# Altium project Interface-Board-7500-0428.PrjPcb (part 1 of 4)
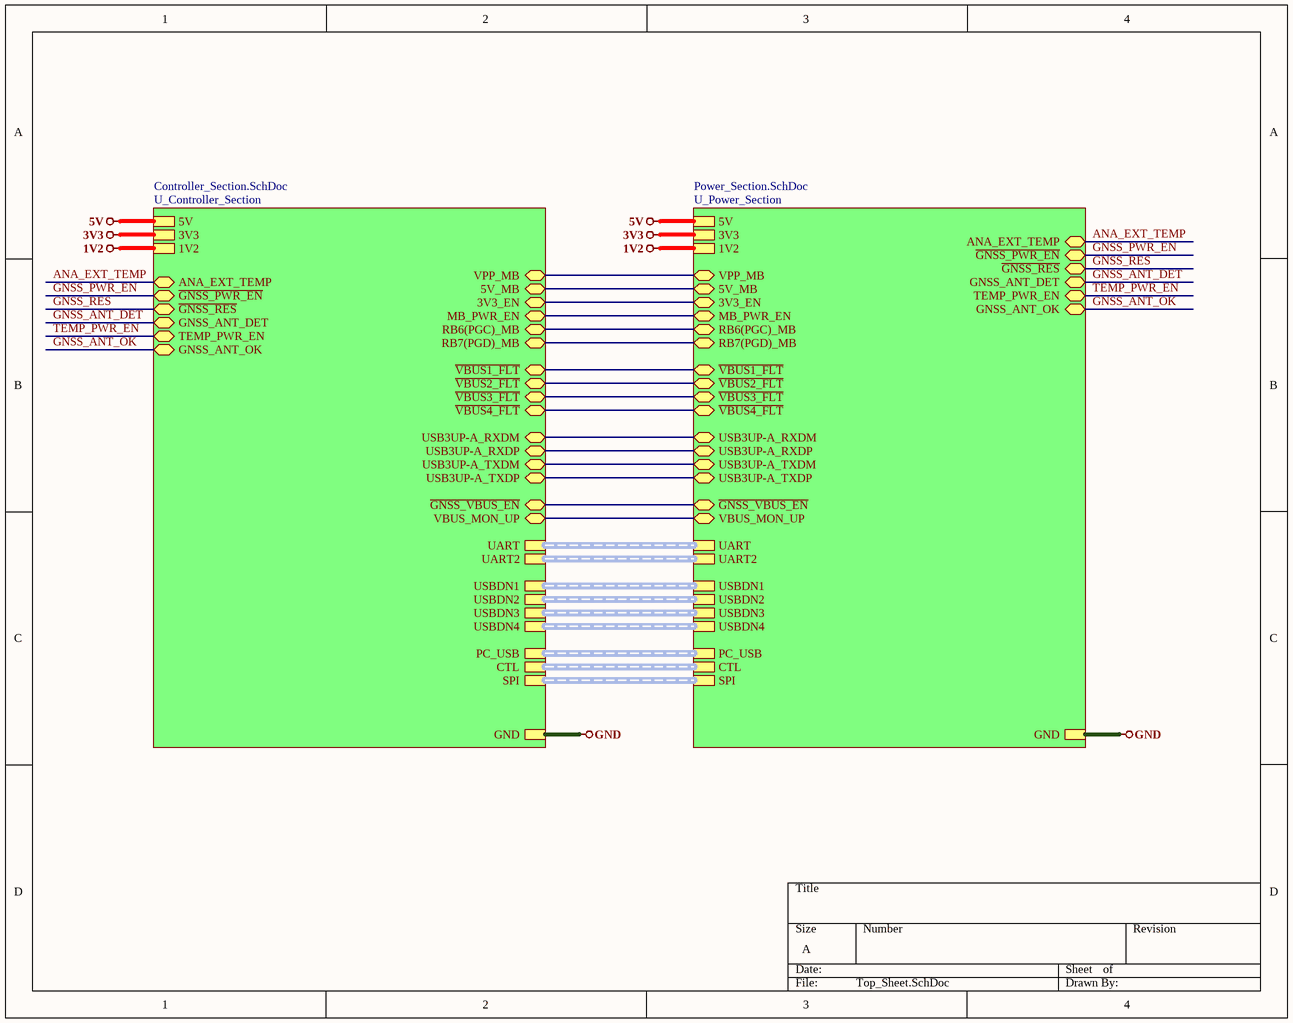
[diagram p0: Top_Sheet.SchDoc]
3 sheets, 247 parts. Net scope: hierarchical (ports join the sheet entries above them; power ports are global).
Board file: PCB_Interface_Board_7500-0428.PcbDoc
Sheets:
  Top_Sheet.SchDoc
    U_Controller_Section = Controller_Section.SchDoc
    U_Power_Section = Power_Section.SchDoc

## Sheet Top_Sheet.SchDoc
size A; SheetNumber: 1; SheetTotal: 3

### Sub-sheets
U_Controller_Section = Controller_Section.SchDoc: RB6(PGC)_MB (bidir), RB7(PGD)_MB (bidir), VPP_MB (bidir), 5V_MB (bidir), 3V3_EN (bidir), MB_PWR_EN (bidir), USB3UP-A_RXDM (bidir), USB3UP-A_RXDP (bidir), USB3UP-A_TXDM (bidir), USB3UP-A_TXDP (bidir), UART (harness UART1), USBDN1 (harness USBDN1), USBDN2 (harness USBDN2), USBDN3 (harness USBDN3), USBDN4 (harness USBDN4), UART2 (harness UART2), PC_USB (harness PC_USB), ~{VBUS1_FLT} (bidir), ~{VBUS2_FLT} (bidir), ~{VBUS3_FLT} (bidir), ~{VBUS4_FLT} (bidir), CTL (harness CTL), ~{GNSS_VBUS_EN} (bidir), SPI (harness SPI), VBUS_MON_UP (bidir), GND, 1V2, 3V3, 5V, ANA_EXT_TEMP (bidir), ~{GNSS_PWR_EN} (bidir), ~{GNSS_RES} (bidir), GNSS_ANT_DET (bidir), TEMP_PWR_EN (bidir), GNSS_ANT_OK (bidir)
U_Power_Section = Power_Section.SchDoc: GND, 1V2, 3V3, 5V, CTL (harness CTL), SPI (harness SPI), 3V3_EN (bidir), MB_PWR_EN (bidir), UART (harness UART1), RB6(PGC)_MB (bidir), RB7(PGD)_MB (bidir), VPP_MB (bidir), 5V_MB (bidir), USBDN1 (harness USBDN1), USBDN2 (harness USBDN2), USBDN3 (harness USBDN3), USBDN4 (harness USBDN4), ~{VBUS1_FLT} (bidir), UART2 (harness UART2), PC_USB (harness PC_USB), USB3UP-A_RXDM (bidir), USB3UP-A_RXDP (bidir), USB3UP-A_TXDM (bidir), USB3UP-A_TXDP (bidir), ~{VBUS2_FLT} (bidir), ~{VBUS3_FLT} (bidir), ~{GNSS_VBUS_EN} (bidir), VBUS_MON_UP (bidir), ~{VBUS4_FLT} (bidir), ANA_EXT_TEMP (bidir), ~{GNSS_PWR_EN} (bidir), ~{GNSS_RES} (bidir), GNSS_ANT_DET (bidir), TEMP_PWR_EN (bidir), GNSS_ANT_OK (bidir)

### Nets
1V2: sheet U_Controller_Section/1V2, sheet U_Power_Section/1V2
3V3: sheet U_Controller_Section/3V3, sheet U_Power_Section/3V3
5V: sheet U_Controller_Section/5V, sheet U_Power_Section/5V
GND: sheet U_Controller_Section/GND, sheet U_Power_Section/GND
3V3_EN: sheet U_Controller_Section/3V3_EN, sheet U_Power_Section/3V3_EN
5V_MB: sheet U_Controller_Section/5V_MB, sheet U_Power_Section/5V_MB
ANA_EXT_TEMP: sheet U_Controller_Section/ANA_EXT_TEMP, sheet U_Power_Section/ANA_EXT_TEMP
~{GNSS_PWR_EN}: sheet U_Controller_Section/~{GNSS_PWR_EN}, sheet U_Power_Section/~{GNSS_PWR_EN}
~{GNSS_RES}: sheet U_Controller_Section/~{GNSS_RES}, sheet U_Power_Section/~{GNSS_RES}
~{GNSS_VBUS_EN}: sheet U_Controller_Section/~{GNSS_VBUS_EN}, sheet U_Power_Section/~{GNSS_VBUS_EN}
GNSS_ANT_DET: sheet U_Controller_Section/GNSS_ANT_DET, sheet U_Power_Section/GNSS_ANT_DET
GNSS_ANT_OK: sheet U_Controller_Section/GNSS_ANT_OK, sheet U_Power_Section/GNSS_ANT_OK
MB_PWR_EN: sheet U_Controller_Section/MB_PWR_EN, sheet U_Power_Section/MB_PWR_EN
RB6(PGC)_MB: sheet U_Controller_Section/RB6(PGC)_MB, sheet U_Power_Section/RB6(PGC)_MB
RB7(PGD)_MB: sheet U_Controller_Section/RB7(PGD)_MB, sheet U_Power_Section/RB7(PGD)_MB
TEMP_PWR_EN: sheet U_Controller_Section/TEMP_PWR_EN, sheet U_Power_Section/TEMP_PWR_EN
USB3UP-A_RXDM: sheet U_Controller_Section/USB3UP-A_RXDM, sheet U_Power_Section/USB3UP-A_RXDM
USB3UP-A_RXDP: sheet U_Controller_Section/USB3UP-A_RXDP, sheet U_Power_Section/USB3UP-A_RXDP
USB3UP-A_TXDM: sheet U_Controller_Section/USB3UP-A_TXDM, sheet U_Power_Section/USB3UP-A_TXDM
USB3UP-A_TXDP: sheet U_Controller_Section/USB3UP-A_TXDP, sheet U_Power_Section/USB3UP-A_TXDP
~{VBUS1_FLT}: sheet U_Controller_Section/~{VBUS1_FLT}, sheet U_Power_Section/~{VBUS1_FLT}
~{VBUS2_FLT}: sheet U_Controller_Section/~{VBUS2_FLT}, sheet U_Power_Section/~{VBUS2_FLT}
~{VBUS3_FLT}: sheet U_Controller_Section/~{VBUS3_FLT}, sheet U_Power_Section/~{VBUS3_FLT}
~{VBUS4_FLT}: sheet U_Controller_Section/~{VBUS4_FLT}, sheet U_Power_Section/~{VBUS4_FLT}
VBUS_MON_UP: sheet U_Controller_Section/VBUS_MON_UP, sheet U_Power_Section/VBUS_MON_UP
VPP_MB: sheet U_Controller_Section/VPP_MB, sheet U_Power_Section/VPP_MB

### Buses and harness runs
harness sheet U_Controller_Section/CTL = sheet U_Power_Section/CTL
harness sheet U_Controller_Section/PC_USB = sheet U_Power_Section/PC_USB
harness sheet U_Controller_Section/SPI = sheet U_Power_Section/SPI
harness sheet U_Controller_Section/UART2 = sheet U_Power_Section/UART2
harness sheet U_Controller_Section/UART = sheet U_Power_Section/UART
harness sheet U_Controller_Section/USBDN1 = sheet U_Power_Section/USBDN1
harness sheet U_Controller_Section/USBDN2 = sheet U_Power_Section/USBDN2
harness sheet U_Controller_Section/USBDN3 = sheet U_Power_Section/USBDN3
harness sheet U_Controller_Section/USBDN4 = sheet U_Power_Section/USBDN4

## Sheet Controller_Section.SchDoc
size 420 x 297 mm; SheetNumber: 3; SheetTotal: 3
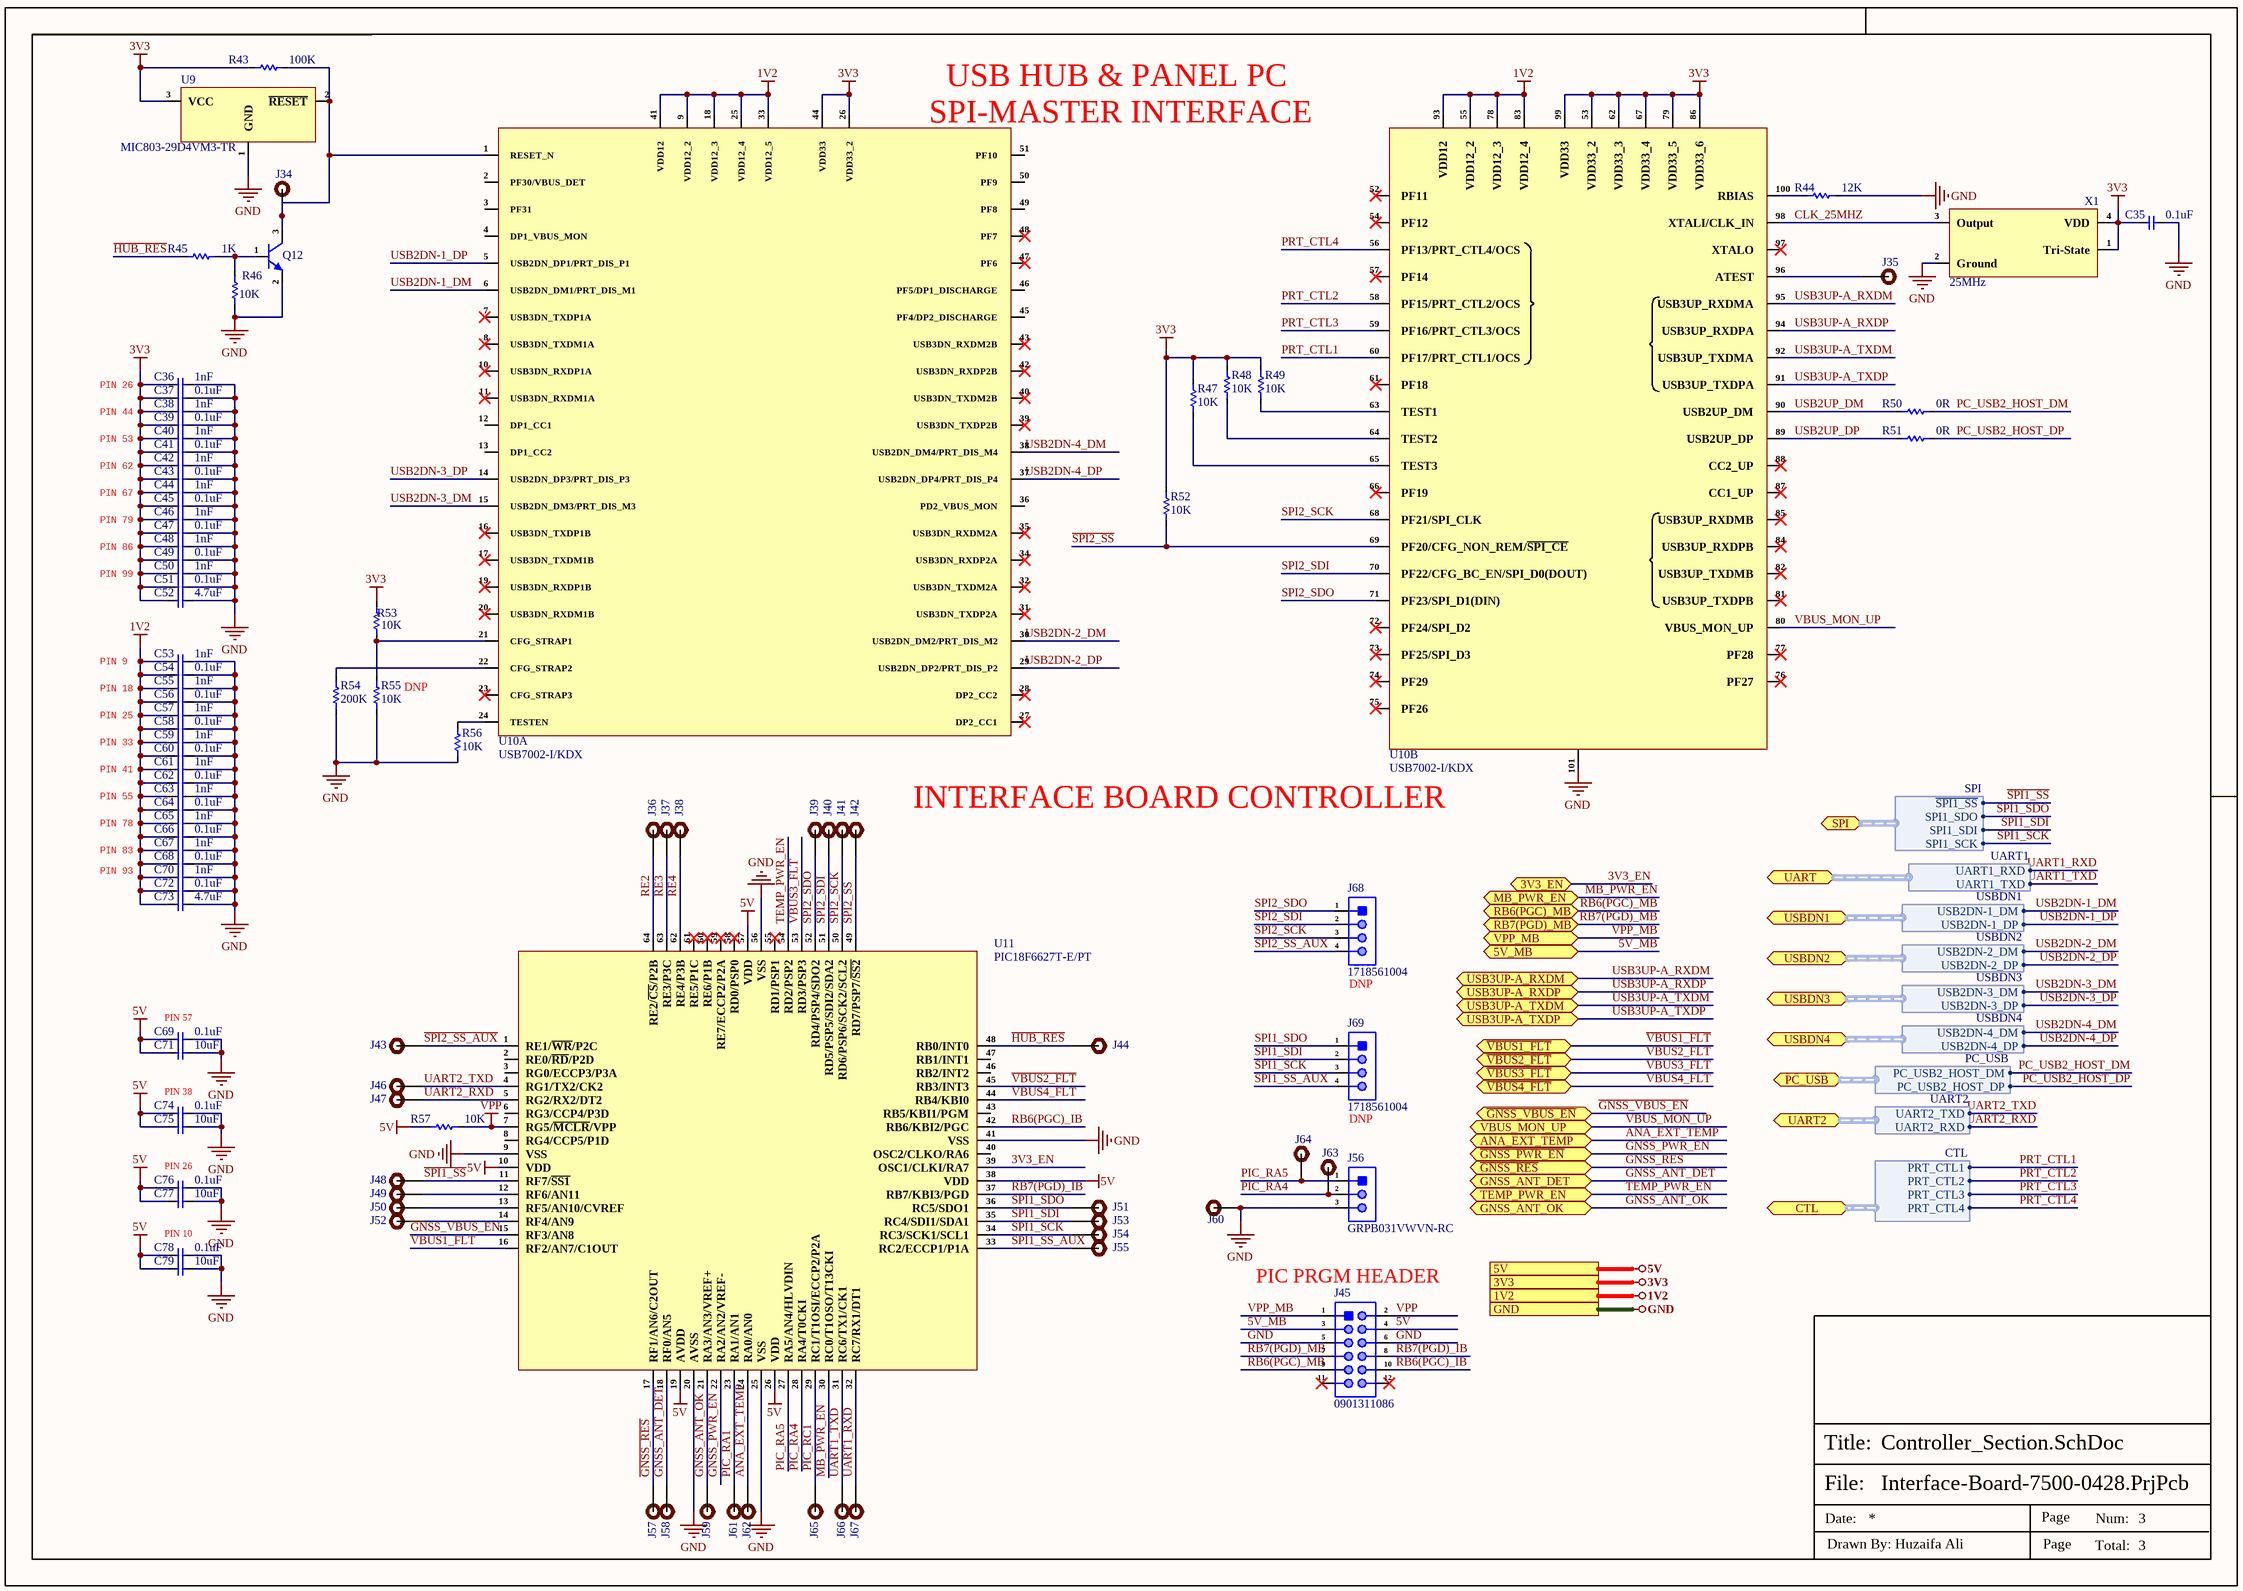
[diagram p1: Controller_Section.SchDoc]

### Parts
C35  0.1uF  [Cap-0402]
C36  1nF  [Cap-0402]
C37  0.1uF  [Cap-0402]
C38  1nF  [Cap-0402]
C39  0.1uF  [Cap-0402]
C40  1nF  [Cap-0402]
C41  0.1uF  [Cap-0402]
C42  1nF  [Cap-0402]
C43  0.1uF  [Cap-0402]
C44  1nF  [Cap-0402]
C45  0.1uF  [Cap-0402]
C46  1nF  [Cap-0402]
C47  0.1uF  [Cap-0402]
C48  1nF  [Cap-0402]
C49  0.1uF  [Cap-0402]
C50  1nF  [Cap-0402]
C51  0.1uF  [Cap-0402]
C52  4.7uF  [Cap-0402]
C53  1nF  [Cap-0402]
C54  0.1uF  [Cap-0402]
C55  1nF  [Cap-0402]
C56  0.1uF  [Cap-0402]
C57  1nF  [Cap-0402]
C58  0.1uF  [Cap-0402]
C59  1nF  [Cap-0402]
C60  0.1uF  [Cap-0402]
C61  1nF  [Cap-0402]
C62  0.1uF  [Cap-0402]
C63  1nF  [Cap-0402]
C64  0.1uF  [Cap-0402]
C65  1nF  [Cap-0402]
C66  0.1uF  [Cap-0402]
C67  1nF  [Cap-0402]
C68  0.1uF  [Cap-0402]
C69  0.1uF  [Cap-0402]
C70  1nF  [Cap-0402]
C71  10uF  [Cap-0402]
C72  0.1uF  [Cap-0402]
C73  4.7uF  [Cap-0402]
C74  0.1uF  [Cap-0402]
C75  10uF  [Cap-0402]
C76  0.1uF  [Cap-0402]
C77  10uF  [Cap-0402]
C78  0.1uF  [Cap-0402]
C79  10uF  [Cap-0402]
J34  Test Point -TH 1.8mm Hole size 0.92mm  [Test Point -TH 1.8mm Hole size 0.92mm]  (value not drawn)  (no BOM)
J35  Test Point -TH 1.8mm Hole size 0.92mm  [Test Point -TH 1.8mm Hole size 0.92mm]  (value not drawn)  (no BOM)
J36  Test Point -TH 1.8mm Hole size 0.92mm  [Test Point -TH 1.8mm Hole size 0.92mm]  (value not drawn)  (no BOM)
J37  Test Point -TH 1.8mm Hole size 0.92mm  [Test Point -TH 1.8mm Hole size 0.92mm]  (value not drawn)  (no BOM)
J38  Test Point -TH 1.8mm Hole size 0.92mm  [Test Point -TH 1.8mm Hole size 0.92mm]  (value not drawn)  (no BOM)
J39  Test Point -TH 1.8mm Hole size 0.92mm  [Test Point -TH 1.8mm Hole size 0.92mm]  (value not drawn)  (no BOM)
J40  Test Point -TH 1.8mm Hole size 0.92mm  [Test Point -TH 1.8mm Hole size 0.92mm]  (value not drawn)  (no BOM)
J41  Test Point -TH 1.8mm Hole size 0.92mm  [Test Point -TH 1.8mm Hole size 0.92mm]  (value not drawn)  (no BOM)
J42  Test Point -TH 1.8mm Hole size 0.92mm  [Test Point -TH 1.8mm Hole size 0.92mm]  (value not drawn)  (no BOM)
J43  Test Point -TH 1.8mm Hole size 0.92mm  [Test Point -TH 1.8mm Hole size 0.92mm]  (value not drawn)  (no BOM)
J44  Test Point -TH 1.8mm Hole size 0.92mm  [Test Point -TH 1.8mm Hole size 0.92mm]  (value not drawn)  (no BOM)
J45  0901311086  [HDR 2x6 Straight (2.54mm)]
J46  Test Point -TH 1.8mm Hole size 0.92mm  [Test Point -TH 1.8mm Hole size 0.92mm]  (value not drawn)  (no BOM)
J47  Test Point -TH 1.8mm Hole size 0.92mm  [Test Point -TH 1.8mm Hole size 0.92mm]  (value not drawn)  (no BOM)
J48  Test Point -TH 1.8mm Hole size 0.92mm  [Test Point -TH 1.8mm Hole size 0.92mm]  (value not drawn)  (no BOM)
J49  Test Point -TH 1.8mm Hole size 0.92mm  [Test Point -TH 1.8mm Hole size 0.92mm]  (value not drawn)  (no BOM)
J50  Test Point -TH 1.8mm Hole size 0.92mm  [Test Point -TH 1.8mm Hole size 0.92mm]  (value not drawn)  (no BOM)
J51  Test Point -TH 1.8mm Hole size 0.92mm  [Test Point -TH 1.8mm Hole size 0.92mm]  (value not drawn)  (no BOM)
J52  Test Point -TH 1.8mm Hole size 0.92mm  [Test Point -TH 1.8mm Hole size 0.92mm]  (value not drawn)  (no BOM)
J53  Test Point -TH 1.8mm Hole size 0.92mm  [Test Point -TH 1.8mm Hole size 0.92mm]  (value not drawn)  (no BOM)
J54  Test Point -TH 1.8mm Hole size 0.92mm  [Test Point -TH 1.8mm Hole size 0.92mm]  (value not drawn)  (no BOM)
J55  Test Point -TH 1.8mm Hole size 0.92mm  [Test Point -TH 1.8mm Hole size 0.92mm]  (value not drawn)  (no BOM)
J56  GRPB031VWVN-RC  [HDR 1x3 Straight (1.27mm)]
J57  Test Point -TH 1.8mm Hole size 0.92mm  [Test Point -TH 1.8mm Hole size 0.92mm]  (value not drawn)  (no BOM)
J58  Test Point -TH 1.8mm Hole size 0.92mm  [Test Point -TH 1.8mm Hole size 0.92mm]  (value not drawn)  (no BOM)
J59  Test Point -TH 1.8mm Hole size 0.92mm  [Test Point -TH 1.8mm Hole size 0.92mm]  (value not drawn)  (no BOM)
J60  Test Point -TH 1.8mm Hole size 0.92mm  [Test Point -TH 1.8mm Hole size 0.92mm]  (value not drawn)  (no BOM)
J61  Test Point -TH 1.8mm Hole size 0.92mm  [Test Point -TH 1.8mm Hole size 0.92mm]  (value not drawn)  (no BOM)
J62  Test Point -TH 1.8mm Hole size 0.92mm  [Test Point -TH 1.8mm Hole size 0.92mm]  (value not drawn)  (no BOM)
J63  Test Point -TH 1.8mm Hole size 0.92mm  [Test Point -TH 1.8mm Hole size 0.92mm]  (value not drawn)  (no BOM)
J64  Test Point -TH 1.8mm Hole size 0.92mm  [Test Point -TH 1.8mm Hole size 0.92mm]  (value not drawn)  (no BOM)
J65  Test Point -TH 1.8mm Hole size 0.92mm  [Test Point -TH 1.8mm Hole size 0.92mm]  (value not drawn)  (no BOM)
J66  Test Point -TH 1.8mm Hole size 0.92mm  [Test Point -TH 1.8mm Hole size 0.92mm]  (value not drawn)  (no BOM)
J67  Test Point -TH 1.8mm Hole size 0.92mm  [Test Point -TH 1.8mm Hole size 0.92mm]  (value not drawn)  (no BOM)
J68  1718561004  [1718561004]
J69  1718561004  [1718561004]
Q12  MMBT2222ATT3G  [MMBT2222ATT3G]  (value not drawn)
R43  100K  [Res-0402]
R44  12K  [Res-0402]
R45  1K  [Res-0402]
R46  10K  [Res-0402]
R47  10K  [Res-0402]
R48  10K  [Res-0402]
R49  10K  [Res-0402]
R50  0R  [Res-0402]
R51  0R  [Res-0402]
R52  10K  [Res-0402]
R53  10K  [Res-0402]
R54  200K  [Res-0402]
R55  10K  [Res-0402]
R56  10K  [Res-0402]
R57  10K  [Res-0402]
U9  MIC803-29D4VM3-TR  [SOT-23]
U10  USB7002-I/KDX  [100-VQFN (12x12)]  (parts A,B of 2)
U11  PIC18F6627T-E/PT  [64-TQFP (10x10)]
X1  25MHz  [SMD2520-4P]

### Ports
1V2 (see Top_Sheet[1A], Power_Section[6D]), 3V3 (see Top_Sheet[1A], Power_Section[6D]), 3V3_EN (bidir, see Top_Sheet[2B], Power_Section[2A]), 5V (see Top_Sheet[1A], Power_Section[6D]), 5V_MB (bidir, see Top_Sheet[2B], Power_Section[6A]), ANA_EXT_TEMP (bidir, see Top_Sheet[1B], Power_Section[1C]), CTL (bidir, harness CTL, see Top_Sheet[2C], Power_Section[4D]), GND (see Top_Sheet[2C], Power_Section[6D]), GNSS_ANT_DET (bidir, see Top_Sheet[1B], Power_Section[1D]), GNSS_ANT_OK (bidir, see Top_Sheet[1B], Power_Section[1D]), MB_PWR_EN (bidir, see Top_Sheet[2B], Power_Section[2A]), PC_USB (bidir, harness PC_USB, see Top_Sheet[2C], Power_Section[2B]), RB6(PGC)_MB (bidir, see Top_Sheet[2B], Power_Section[6A]), RB7(PGD)_MB (bidir, see Top_Sheet[2B], Power_Section[6A]), SPI (bidir, harness SPI, see Top_Sheet[2C], Power_Section[1A]), TEMP_PWR_EN (bidir, see Top_Sheet[1B], Power_Section[2C]), UART2 (bidir, harness UART2, see Top_Sheet[2C], Power_Section[2B]), UART (bidir, harness UART1, see Top_Sheet[2C], Power_Section[4B]), USB3UP-A_RXDM (bidir, see Top_Sheet[2B], Power_Section[2B]), USB3UP-A_RXDP (bidir, see Top_Sheet[2B], Power_Section[2B]), USB3UP-A_TXDM (bidir, see Top_Sheet[2B], Power_Section[2B]), USB3UP-A_TXDP (bidir, see Top_Sheet[2B], Power_Section[2B]), USBDN1 (bidir, harness USBDN1, see Top_Sheet[2C], Power_Section[4B]), USBDN2 (bidir, harness USBDN2, see Top_Sheet[2C], Power_Section[4B]), USBDN3 (bidir, harness USBDN3, see Top_Sheet[2C], Power_Section[4B]), USBDN4 (bidir, harness USBDN4, see Top_Sheet[2C], Power_Section[4B]), VBUS_MON_UP (bidir, see Top_Sheet[2C], Power_Section[2B]), VPP_MB (bidir, see Top_Sheet[2B], Power_Section[6A]), ~{GNSS_PWR_EN} (bidir, see Top_Sheet[1B], Power_Section[1D]), ~{GNSS_RES} (bidir, see Top_Sheet[1B], Power_Section[1D]), ~{GNSS_VBUS_EN} (bidir, see Top_Sheet[2B], Power_Section[4D]), ~{VBUS1_FLT} (bidir, see Top_Sheet[2B], Power_Section[3C]), ~{VBUS2_FLT} (bidir, see Top_Sheet[2B], Power_Section[3C]), ~{VBUS3_FLT} (bidir, see Top_Sheet[2B], Power_Section[5C]), ~{VBUS4_FLT} (bidir, see Top_Sheet[2B], Power_Section[5C])

### Harnesses
UART1: UART1_RXD, UART1_TXD
USBDN1: USB2DN-1_DM, USB2DN-1_DP
USBDN2: USB2DN-2_DM, USB2DN-2_DP
USBDN3: USB2DN-3_DM, USB2DN-3_DP
USBDN4: USB2DN-4_DM, USB2DN-4_DP
UART2: UART2_TXD, UART2_RXD
PC_USB: PC_USB2_HOST_DM, PC_USB2_HOST_DP
CTL: PRT_CTL1, PRT_CTL2, PRT_CTL3, PRT_CTL4
SPI: SPI1_SDO, SPI1_SCK, SPI1_SDI, ~{SPI1_SS}

### Nets
1V2: C53.1 C54.1 C55.1 C56.1 C57.1 C58.1 C59.1 C60.1 C61.1 C62.1 C63.1 C64.1 C65.1 C66.1 C67.1 C68.1 C70.1 C72.1 C73.1 U10.9(VDD12_2) U10.18(VDD12_3) U10.25(VDD12_4) U10.33(VDD12_5) U10.41(VDD12) U10.55(VDD12_2) U10.78(VDD12_3) U10.83(VDD12_4) U10.93(VDD12) ; port 1V2
3V3: C35.1 C36.1 C37.1 C38.1 C39.1 C40.1 C41.1 C42.1 C43.1 C44.1 C45.1 C46.1 C47.1 C48.1 C49.1 C50.1 C51.1 C52.1 R43.2 R47.2 R48.2 R49.2 R52.2 R53.2 U9.3(VCC) U10.26(VDD33_2) U10.44(VDD33) U10.53(VDD33_2) U10.62(VDD33_3) U10.67(VDD33_4) U10.79(VDD33_5) U10.86(VDD33_6) U10.99(VDD33) X1.1(Tri-State) X1.4(VDD) ; port 3V3
5V: C69.1 C71.1 C74.1 C75.1 C76.1 C77.1 C78.1 C79.1 J45.4 R57.1 U11.10(VDD) U11.19(AVDD) U11.26(VDD) U11.38(VDD) U11.57(VDD) ; port 5V
GND: C35.2 C36.2 C37.2 C38.2 C39.2 C40.2 C41.2 C42.2 C43.2 C44.2 C45.2 C46.2 C47.2 C48.2 C49.2 C50.2 C51.2 C52.2 C53.2 C54.2 C55.2 C56.2 C57.2 C58.2 C59.2 C60.2 C61.2 C62.2 C63.2 C64.2 C65.2 C66.2 C67.2 C68.2 C69.2 C70.2 C71.2 C72.2 C73.2 C74.2 C75.2 C76.2 C77.2 C78.2 C79.2 J45.5 J45.6 J56.3 J60.1 Q12.2(E) R44.2 R46.1 R54.1 R55.1 R56.1 U9.1(GND) U10.101(VSS) U11.9(VSS) U11.20(AVSS) U11.25(VSS) U11.41(VSS) U11.56(VSS) X1.2(Ground) ; port GND
VPP: J45.2 R57.2 U11.7(RG5/~{MCLR}/VPP)
3V3_EN: U11.39(OSC1/CLKI/RA7) ; port 3V3_EN
5V_MB: J45.3 ; port 5V_MB
ANA_EXT_TEMP: J62.1 U11.24(RA0/AN0) ; port ANA_EXT_TEMP
CLK_25MHZ: U10.98(XTALI/CLK_IN) X1.3(Output)
~{GNSS_PWR_EN}: U11.22(RA2/AN2/VREF-) ; port ~{GNSS_PWR_EN}
~{GNSS_RES}: J57.1 U11.17(RF1/AN6/C2OUT) ; port ~{GNSS_RES}
~{GNSS_VBUS_EN}: U11.15(RF3/AN8) ; port ~{GNSS_VBUS_EN}
GNSS_ANT_DET: J58.1 U11.18(RF0/AN5) ; port GNSS_ANT_DET
GNSS_ANT_OK: J59.1 U11.21(RA3/AN3/VREF+) ; port GNSS_ANT_OK
~{HUB_RES}: J44.1 R45.1 U11.48(RB0/INT0)
MB_PWR_EN: U11.30(RC0/T1OSO/T13CKI) ; port MB_PWR_EN
PC_USB2_HOST_DM: R50.2 ; port PC_USB.PC_USB2_HOST_DM
PC_USB2_HOST_DP: R51.2 ; port PC_USB.PC_USB2_HOST_DP
PIC_RA1: J61.1 U11.23(RA1/AN1)
PIC_RA4: J56.2 J63.1 U11.28(RA4/T0CKI)
PIC_RA5: J56.1 J64.1 U11.27(RA5/AN4/HLVDIN)
PIC_RC1: J65.1 U11.29(RC1/T1OSI/ECCP2/P2A)
PRT_CTL1: U10.60(PF17/PRT_CTL1/OCS) ; port CTL.PRT_CTL1
PRT_CTL2: U10.58(PF15/PRT_CTL2/OCS) ; port CTL.PRT_CTL2
PRT_CTL3: U10.59(PF16/PRT_CTL3/OCS) ; port CTL.PRT_CTL3
PRT_CTL4: U10.56(PF13/PRT_CTL4/OCS) ; port CTL.PRT_CTL4
RB6(PGC)_IB: J45.10 U11.42(RB6/KBI2/PGC)
RB6(PGC)_MB: J45.9 ; port RB6(PGC)_MB
RB7(PGD)_IB: J45.8 U11.37(RB7/KBI3/PGD)
RB7(PGD)_MB: J45.7 ; port RB7(PGD)_MB
RE2: J36.1 U11.64(RE2/~{CS}/P2B)
RE3: J37.1 U11.63(RE3/P3C)
RE4: J38.1 U11.62(RE4/P3B)
~{SPI1_SS}: J48.1 U11.11(RF7/~{SS1}) ; port SPI.~{SPI1_SS}
~{SPI1_SS_AUX}: J55.1 J69.4 U11.33(RC2/ECCP1/P1A)
~{SPI2_SS}: J42.1 R52.1 U10.69(PF20/CFG_NON_REM/~{SPI_CE}) U11.49(RD7/PSP7/~{SS2})
~{SPI2_SS_AUX}: J43.1 J68.4 U11.1(RE1/~{WR}/P2C)
SPI1_SCK: J54.1 J69.3 U11.34(RC3/SCK1/SCL1) ; port SPI.SPI1_SCK
SPI1_SDI: J53.1 J69.2 U11.35(RC4/SDI1/SDA1) ; port SPI.SPI1_SDI
SPI1_SDO: J51.1 J69.1 U11.36(RC5/SDO1) ; port SPI.SPI1_SDO
SPI2_SCK: J41.1 J68.3 U10.68(PF21/SPI_CLK) U11.50(RD6/PSP6/SCK2/SCL2)
SPI2_SDI: J40.1 J68.2 U10.70(PF22/CFG_BC_EN/SPI_D0(DOUT)) U11.51(RD5/PSP5/SDI2/SDA2)
SPI2_SDO: J39.1 J68.1 U10.71(PF23/SPI_D1(DIN)) U11.52(RD4/PSP4/SDO2)
TEMP_PWR_EN: U11.54(RD2/PSP2) ; port TEMP_PWR_EN
UART1_RXD: J67.1 U11.32(RC7/RX1/DT1) ; port UART.UART1_RXD
UART1_TXD: J66.1 U11.31(RC6/TX1/CK1) ; port UART.UART1_TXD
UART2_RXD: J47.1 U11.5(RG2/RX2/DT2) ; port UART2.UART2_RXD
UART2_TXD: J46.1 U11.4(RG1/TX2/CK2) ; port UART2.UART2_TXD
USB2DN-1_DM: U10.6(USB2DN_DM1/PRT_DIS_M1) ; port USBDN1.USB2DN-1_DM
USB2DN-1_DP: U10.5(USB2DN_DP1/PRT_DIS_P1) ; port USBDN1.USB2DN-1_DP
USB2DN-2_DM: U10.30(USB2DN_DM2/PRT_DIS_M2) ; port USBDN2.USB2DN-2_DM
USB2DN-2_DP: U10.29(USB2DN_DP2/PRT_DIS_P2) ; port USBDN2.USB2DN-2_DP
USB2DN-3_DM: U10.15(USB2DN_DM3/PRT_DIS_M3) ; port USBDN3.USB2DN-3_DM
USB2DN-3_DP: U10.14(USB2DN_DP3/PRT_DIS_P3) ; port USBDN3.USB2DN-3_DP
USB2DN-4_DM: U10.38(USB2DN_DM4/PRT_DIS_M4) ; port USBDN4.USB2DN-4_DM
USB2DN-4_DP: U10.37(USB2DN_DP4/PRT_DIS_P4) ; port USBDN4.USB2DN-4_DP
USB2UP_DM: R50.1 U10.90(USB2UP_DM)
USB2UP_DP: R51.1 U10.89(USB2UP_DP)
USB3UP-A_RXDM: U10.95(USB3UP_RXDMA) ; port USB3UP-A_RXDM
USB3UP-A_RXDP: U10.94(USB3UP_RXDPA) ; port USB3UP-A_RXDP
USB3UP-A_TXDM: U10.92(USB3UP_TXDMA) ; port USB3UP-A_TXDM
USB3UP-A_TXDP: U10.91(USB3UP_TXDPA) ; port USB3UP-A_TXDP
~{VBUS1_FLT}: U11.16(RF2/AN7/C1OUT) ; port ~{VBUS1_FLT}
~{VBUS2_FLT}: U11.45(RB3/INT3) ; port ~{VBUS2_FLT}
~{VBUS3_FLT}: U11.53(RD3/PSP3) ; port ~{VBUS3_FLT}
~{VBUS4_FLT}: U11.44(RB4/KBI0) ; port ~{VBUS4_FLT}
VBUS_MON_UP: U10.80(VBUS_MON_UP) ; port VBUS_MON_UP
VPP_MB: J45.1 ; port VPP_MB
NetJ34_1: J34.1 Q12.3(C) R43.1 U9.2(~{RESET}) U10.1(RESET_N)
NetJ35_1: J35.1 U10.96(ATEST)
NetJ49_1: J49.1 U11.12(RF6/AN11)
NetJ50_1: J50.1 U11.13(RF5/AN10/CVREF)
NetJ52_1: J52.1 U11.14(RF4/AN9)
NetQ12_1: Q12.1(B) R45.2 R46.2
NetR44_1: R44.1 U10.100(RBIAS)
NetR47_1: R47.1 U10.65(TEST3)
NetR48_1: R48.1 U10.64(TEST2)
NetR49_1: R49.1 U10.63(TEST1)
NetR53_1: R53.1 R55.2 U10.21(CFG_STRAP1)
NetR54_2: R54.2 U10.22(CFG_STRAP2)
NetR56_2: R56.2 U10.24(TESTEN)

Not connected (* = marked no-connect by the designer): J45 11* 12*; U10 2(PF30/VBUS_DET) 3(PF31) 4(DP1_VBUS_MON) 7(USB3DN_TXDP1A)* 8(USB3DN_TXDM1A)* 10(USB3DN_RXDP1A)* 11(USB3DN_RXDM1A)* 12(DP1_CC1) 13(DP1_CC2) 16(USB3DN_TXDP1B)* 17(USB3DN_TXDM1B)* 19(USB3DN_RXDP1B)* 20(USB3DN_RXDM1B)* 23(CFG_STRAP3)* 27(DP2_CC1)* 28(DP2_CC2)* 31(USB3DN_TXDP2A)* 32(USB3DN_TXDM2A)* 34(USB3DN_RXDP2A)* 35(USB3DN_RXDM2A)* 36(PD2_VBUS_MON) 39(USB3DN_TXDP2B)* 40(USB3DN_TXDM2B)* 42(USB3DN_RXDP2B)* 43(USB3DN_RXDM2B)* 45(PF4/DP2_DISCHARGE) 46(PF5/DP1_DISCHARGE) 47(PF6)* 48(PF7)* 49(PF8) 50(PF9) 51(PF10) 52(PF11)* 54(PF12)* 57(PF14)* 61(PF18)* 66(PF19)* 72(PF24/SPI_D2)* 73(PF25/SPI_D3)* 74(PF29)* 75(PF26)* 76(PF27)* 77(PF28)* 81(USB3UP_TXDPB)* 82(USB3UP_TXDMB)* 84(USB3UP_RXDPB)* 85(USB3UP_RXDMB)* 87(CC1_UP)* 88(CC2_UP)* 97(XTALO)*; U11 2(RE0/~{RD}/P2D) 3(RG0/ECCP3/P3A) 6(RG3/CCP4/P3D) 8(RG4/CCP5/P1D) 40(OSC2/CLKO/RA6) 43(RB5/KBI1/PGM) 46(RB2/INT2) 47(RB1/INT1) 55(RD1/PSP1)* 58(RD0/PSP0)* 59(RE7/ECCP2/P2A)* 60(RE6/P1B)* 61(RE5/P1C)*

### Notes on the sheet
- (near U10) USB HUB & PANEL PC
  SPI-MASTER INTERFACE
- PIN 26
- PIN 44
- PIN 53
- PIN 62
- PIN 67
- PIN 79
- PIN 99
- PIN 86
- PIN 9
- PIN 18
- PIN 25
- (near R55) DNP
- PIN 41
- PIN 33
- PIN 55
- PIN 78
- PIN 83
- (near U10) INTERFACE BOARD CONTROLLER
- PIN 93
- (near J68) DNP
- (near C69) PIN 57
- (near C74) PIN 38
- (near J69) DNP
- (near C76) PIN 26
- (near C78) PIN 10
- (near J45) PIC PRGM HEADER
- File:
- Title:
- Date:
- Page
- Num:
- Total:
- Drawn By: Huzaifa Ali

### Library data of the parts
C35 C37 C39 C41 C43 C45 C47 C49 C51 C54 C56 C58 C60 C62 C64 C66 C68 C69 C72 C74 C76 C78 = GRM155R71C104KA88D: CAP CER 0.1UF 16V X7R 0402; Manufacturer: Murata; Material: Ceramic; Value: 100nF; Tolerance: 10%; Insulation Resistance: 10GR; Item Type: Capacitor; Supplier 1: Arrow Electronics; Manufacturer Part Number: GRM155R71C104KA88D; RoHS: Yes; Category: Ceramic Capacitors; Stock 1: 1690322; Pricing 1: 10000=0.00480, 30000=0.00470, 100000=0.00350, 250000=0.00330 (USD); Mounting Technology: Surface Mount; Case/Package: 0402; Pins: 2; Case Code (Metric): 1005; Case Code (Imperial): 0402; Dielectric Material: Ceramic; Min Operating Temperature: -55°C; Max Operating Temperature: 125°C; Voltage Rating: 16V; Packaging: Tape and Reel; Voltage Rating (DC): 16V; Package Quantity: 1; Dielectric: X7R; Termination: SMD/SMT; Voltage: 16V; Series: GRM; Length: 1mm; Width: 0.02inch; Height: 0.5mm; Thickness: 0.022inch; Depth: 0.5mm; Radiation Hardening: No; Lead Free: Lead Free; RoHS Compliant: Yes; ComponentLink1URL: https://datasheet.ciiva.com/129/grm155r71c104ka88-01-129739.pdf?src-supplier=Digi-Key; ComponentLink1Description: https://datasheet.ciiva.com/129/grm155r71c104ka88-01-129739.pdf?src-supplier=Digi-Key; ComponentLink2URL: https://datasheet.ciiva.com/129/grm155r71c104ka88-01-129740.pdf?src-supplier=Digi-Key; ComponentLink2Description: https://datasheet.ciiva.com/129/grm155r71c104ka88-01-129740.pdf?src-supplier=Digi-Key; ComponentLink3URL: https://datasheet.ciiva.com/18102/getdatasheetpartid-85307-18102905.pdf?src-supplier=Verical; ComponentLink3Description: https://datasheet.ciiva.com/18102/getdatasheetpartid-85307-18102905.pdf?src-supplier=Verical; ComponentLink4URL: https://datasheet.ciiva.com/29199/454098-da-01-en-vs-kondensator-0402-29199799.pdf?src-supplier=Conrad; ComponentLink4Description: https://datasheet.ciiva.com/29199/454098-da-01-en-vs-kondensator-0402-29199799.pdf?src-supplier=Conrad; ComponentLink5URL: https://datasheet.ciiva.com/7937/4360-7937615.pdf?src-supplier=Element14; ComponentLink5Description: https://datasheet.ciiva.com/7937/4360-7937615.pdf?src-supplier=Element14; ComponentLink6URL: https://datasheet.ciiva.com/14116/grmseries-highdielectrictype-eng-14116878.pdf?src-supplier=Distrelec; ComponentLink6Description: https://datasheet.ciiva.com/14116/grmseries-highdielectrictype-eng-14116878.pdf?src-supplier=Distrelec; ComponentLink7URL: https://datasheet.ciiva.com/14103/grmseries-highdielectrictype-eng-14103750.pdf?src-supplier=Distrelec; ComponentLink7Description: https://datasheet.ciiva.com/14103/grmseries-highdielectrictype-eng-14103750.pdf?src-supplier=Distrelec; ComponentLink8URL: https://datasheet.ciiva.com/28534/4360-28534127.pdf?src-supplier=Element14; ComponentLink8Description: https://datasheet.ciiva.com/28534/4360-28534127.pdf?src-supplier=Element14; ComponentLink9URL: https://datasheet.ciiva.com/28534/4360-28534133.pdf?src-supplier=Element14; ComponentLink9Description: https://datasheet.ciiva.com/28534/4360-28534133.pdf?src-supplier=Element14; ComponentLink10URL: https://datasheet.ciiva.com/16199/product-16199000.pdf?src-supplier=Future+Electronics; ComponentLink10Description: https://datasheet.ciiva.com/16199/product-16199000.pdf?src-supplier=Future+Electronics; Supplier Part Number 1: GRM155R71C104KA88D; LCSC Part Number: C71629
C36 C38 C40 C42 C44 C46 C48 C50 C53 C55 C57 C59 C61 C63 C65 C67 C70 = GRM155R61C102KA01D: Multilayer Ceramic Capacitor, 1000 pF, 16 V, ± 10%, X5R, 0402 [1005 Metric]; Manufacturer: Murata; Voltage Rating: 16V; Supplier: Digikey; Supplier Part Number: 490-6308-6-ND; Manufacturer Part Number: GRM155R61C102KA01D; RoHS: Yes; Category: Ceramic Capacitors; Stock: 36126; Pricing: 1=0.1, 10=0.025, 50=0.0142, 100=0.011, 500=0.0083, 1000=0.00651, 2500=0.00592, 5000=0.00545 (USD); Mounting Technology: Surface Mount; Case/Package: 0402; Case Code (Metric): 1005; Case Code (Imperial): 0402; Min Operating Temperature: -55°C; Max Operating Temperature: 85°C; Value: 1nF; Tolerance: 10%; Dielectric: X5R; Package Quantity: 1; Packaging: Tape and Reel; Voltage Rating (DC): 16V; Termination: SMD/SMT; Series: GRM; Construction: Flat; Length: 1mm; Width: 0.02inch; Height: 0.5mm; Thickness: 0.022inch; Depth: 0.5mm; Radiation Hardening: No; Lead Free: Lead Free; RoHS Compliant: Yes; ComponentLink1URL: https://datasheet.ciiva.com/6263/product-6263633.pdf?src-supplier=Digikey; ComponentLink1Description: https://datasheet.ciiva.com/6263/product-6263633.pdf?src-supplier=Digikey; ComponentLink2URL: https://datasheet.ciiva.com/6263/partnumbering-e-01-6263626.pdf?src-supplier=Digikey; ComponentLink2Description: https://datasheet.ciiva.com/6263/partnumbering-e-01-6263626.pdf?src-supplier=Digikey; ComponentLink3URL: https://datasheet.ciiva.com/6263/partnumbering-e-01-6263629.pdf?src-supplier=Digikey; ComponentLink3Description: https://datasheet.ciiva.com/6263/partnumbering-e-01-6263629.pdf?src-supplier=Digikey
C52 C73 = CC0402KRX5R6BB475: CAP CER 4.7UF 10V X5R 0402; Manufacturer: Yageo; Tolerance: 10%; Supplier 1: Farnell; Manufacturer Part Number: CC0402KRX5R6BB475; RoHS: Yes; Category: Ceramic Capacitors; Stock 1: 20000; Pricing 1: 10000=0.02310, 50000=0.02100 (GBP); Mount: Surface Mount; Case/Package: 0402; Case Code (Imperial): 0402; Case Code (Metric): 1005; Min Operating Temperature: -55°C; Max Operating Temperature: 85°C; Packaging: Cut Tape; Capacitance: 4.7uF; Voltage Rating: 10V; RoHS Compliant: Yes; ComponentLink1URL: http://www.yageo.com/documents/recent/UPY-GPHC_X5R_4V-to-50V_25.pdf?src-supplier=Digi-Key; ComponentLink1Description: http://www.yageo.com/documents/recent/UPY-GPHC_X5R_4V-to-50V_25.pdf?src-supplier=Digi-Key; Supplier Part Number 1: 3871698; LCSC Part Number: C326586
C71 C75 C77 C79 = CC0402MRX5R6BB106: CAP CER 10UF 10V X5R 0402; Manufacturer: Yageo; Tolerance: 20%; Item Type: Capacitor; Supplier 1: Future Electronics; Manufacturer Part Number: CC0402MRX5R6BB106; RoHS: Yes; Category: Ceramic Capacitors; Stock 1: 80000; Pricing 1: 10000=0.02650, 20000=0.02590, 30000=0.02550, 40000=0.02530, 50000=0.02450 (USD); Mount: Surface Mount; Case/Package: 0402; Case Code (Imperial): 0402; Case Code (Metric): 1005; Min Operating Temperature: -55°C; Max Operating Temperature: 85°C; Packaging: Tape and Reel; Capacitance: 10uF; Voltage Rating: 10V; RoHS Compliant: Yes; ComponentLink1URL: http://www.yageo.com/documents/recent/UPY-GPHC_X5R_4V-to-50V_25.pdf?src-supplier=Digi-Key; ComponentLink1Description: http://www.yageo.com/documents/recent/UPY-GPHC_X5R_4V-to-50V_25.pdf?src-supplier=Digi-Key; Supplier Part Number 1: 6097631; LCSC Part Number: C962143
J45 = 0901311086: 2.54mm Pitch C-Grid III Header, Dual Row, Vertical, 12 Circuits, 0.10µm Gold (Au) Selective Plating; Manufacturer: Molex; Number of Positions: 12; Pitch: 0.1inch; Item Type: Header; Supplier: Digikey; Supplier Part Number: WM20588-ND; Manufacturer Part Number: 0901311086; RoHS: Yes; Category: Uncategorized; Stock: 1766; Pricing: 1=1.44, 10=1.224, 80=1.01075, 1200=0.79795, 6000=0.70752, 10800=0.69156 (USD); Mounting Technology: Through Hole; Color: Black; Contact Plating: Gold; Contact Material: Brass; Contact Shape: Square; Contact Finish - Mating: GOLD; Insulation Material: Glass; Insulation Color: Black; Packaging: Bulk; Number of Rows: 2; Termination: Solder; Fastening Type: Pull; Series: C-Grid III™ 90131; Contact Type: Male Pin; Row Spacing: 0.1inch; Contact Mating Length: 0.266inch; RoHS Compliant: Yes; Flammability Rating: UL94 V-0; ComponentLink1URL: https://www.molex.com/pdm_docs/ps/PS-99020-0001-001.pdf?src-supplier=Digikey; ComponentLink1Description: https://www.molex.com/pdm_docs/ps/PS-99020-0001-001.pdf?src-supplier=Digikey; ComponentLink2URL: http://www.molex.com/pdm_docs/sd/901311086_sd.pdf?src-supplier=Digikey; ComponentLink2Description: http://www.molex.com/pdm_docs/sd/901311086_sd.pdf?src-supplier=Digikey
J56 = GRPB031VWVN-RC: CONN HEADER VERT 3POS 1.27MM; Manufacturer: Sullins; Item Type: Connectors; Number of Positions: 3; Supplier: Digikey; Supplier Part Number: S9014E-03-ND; Manufacturer Part Number: GRPB031VWVN-RC; RoHS: Yes; Stock: 29991; Pricing: 1=0.28, 10=0.238, 100=0.185, 500=0.15862, 1000=0.13218, 5000=0.1133, 10000=0.1079 (USD); Mounting Technology: Through Hole; Contact Material: Brass; Contact Shape: Square; Contact Finish - Mating: GOLD; Insulation Material: Nylon; Min Operating Temperature: -40°C; Max Operating Temperature: 105°C; Number of Rows: 1; Packaging: Bulk; Termination: Solder; Connector Type: Header; Contact Type: Male Pin; Fastening Type: Pull; Series: -; Pitch: 1.27mm; Lead Free: Lead Free; RoHS Compliant: Yes; Flammability Rating: UL94 V-0; ComponentLink1URL: https://datasheet.ciiva.com/726/71-grpb-1vwvn-rc-10957-c-726649.pdf?src-supplier=Digikey; ComponentLink1Description: https://datasheet.ciiva.com/726/71-grpb-1vwvn-rc-10957-c-726649.pdf?src-supplier=Digikey
J68 J69 = 1718561004: CONN HEADER VERT 4POS 2.54MM; Manufacturer: Molex; Supplier: Digikey; Supplier Part Number: WM10288-ND; Manufacturer Part Number: 1718561004; RoHS: Yes; Item Type: Header; Pricing: 1=0.73, 10=0.617, 100=0.4796, 4000=0.34254, 8000=0.30829, 12000=0.30372 (USD); ComponentLink1URL: https://datasheet.ciiva.com/24135/1718561004-pcb-headers-295430-24135941.pdf?src-supplier=Mouser; ComponentLink1Description: https://datasheet.ciiva.com/24135/1718561004-pcb-headers-295430-24135941.pdf?src-supplier=Mouser; ComponentLink2URL: https://datasheet.ciiva.com/29151/1718560002-sd-29151999.pdf?src-supplier=Digikey; ComponentLink2Description: https://datasheet.ciiva.com/29151/1718560002-sd-29151999.pdf?src-supplier=Digikey
Q12 = MMBT2222ATT3G: Small Signal Bipolar Transistor, 0.6A I(C), 40V V(BR)CEO, 1-Element, NPN, Silicon; Manufacturer: ON Semiconductor; Supplier: Digikey; Supplier Part Number: MMBT2222ATT3GOSCT-ND; Manufacturer Part Number: MMBT2222ATT3G; RoHS: Yes; Category: BJTs; Stock: 7029; Pricing: 1=0.12, 10=0.082, 100=0.0441, 500=0.03466, 1000=0.02407, 2000=0.01994, 5000=0.01885 (USD); ComponentLink1URL: https://datasheet.ciiva.com/980/mmbt2222lt1-d-980718.pdf?src-supplier=Digikey; ComponentLink1Description: https://datasheet.ciiva.com/980/mmbt2222lt1-d-980718.pdf?src-supplier=Digikey; ComponentLink2URL: https://datasheet.ciiva.com/4724/mmbt2222att1-d-81771-4724629.pdf?src-supplier=Mouser; ComponentLink2Description: https://datasheet.ciiva.com/4724/mmbt2222att1-d-81771-4724629.pdf?src-supplier=Mouser
R43 = RT0402BRD07100KL: RES SMD 100K OHM 0.1% 1/16W 0402; Manufacturer: Yageo; Voltage Rating (DC): 50V; Item Type: Resistor; Supplier: Digikey; Supplier Part Number: YAG1343CT-ND; Manufacturer Part Number: RT0402BRD07100KL; RoHS: Yes; Category: Chip SMD Resistors; Stock: 62932; Pricing: 1=0.16, 10=0.121, 50=0.0958, 100=0.0859, 500=0.0654, 1000=0.0578, 5000=0.04283 (USD); ComponentLink1URL: https://datasheet.ciiva.com/12724/pyu-rt-1-to-0-05-rohs-l-4-12724954.pdf?src-supplier=Mouser; ComponentLink1Description: https://datasheet.ciiva.com/12724/pyu-rt-1-to-0-05-rohs-l-4-12724954.pdf?src-supplier=Mouser; LCSC Part Number: C852472
R44 = RC0402FR-0712KL: RES 12K OHM 1% 1/16W 0402; Manufacturer: Yageo; Value: 12kR; Power Rating: 62.5mW; Voltage Rating: 50V; Max Power Dissipation: 63mW; Temperature Coefficient: 100ppm/°C; Supplier: Future Electronics; Supplier Part Number: 5655139; Manufacturer Part Number: RC0402FR-0712KL; RoHS: Yes; Category: Chip SMD Resistors; Stock: 2030000; Pricing: 10000=0.0011, 100000=0.0011, 300000=0.001, 750000=0.001, 2000000=0.0009 (USD); Case/Package: 0402; Case Code (Metric): 1005; Case Code (Imperial): 0402; Weight: 2.3E-05oz; Min Operating Temperature: -55°C; Max Operating Temperature: 155°C; Packaging: Tape and Reel; Tolerance: 1%; Package Quantity: 1; Resistor Type: Thick Film; Number of Terminations: 2; Termination: SMD/SMT; Features: Moisture Resistant; Series: RC; Resistance Tolerance: 1%; Construction: Rectangular; Voltage Rating (AC): 50V; Length: 1mm; Width: 0.02inch; Height: 0.016inch; Depth: 0.5mm; Reach SVHC Compliant: No; Military Standard: Not; RoHS Compliant: Yes; Lead Free: 5697LeadFree; ComponentLink1URL: https://datasheet.ciiva.com/46412/1018594-46412831.pdf?src-supplier=Element14; ComponentLink1Description: https://datasheet.ciiva.com/46412/1018594-46412831.pdf?src-supplier=Element14; ComponentLink2URL: https://datasheet.ciiva.com/2453/pyu-r-int-thick-7-2453380.pdf?src-supplier=Digikey; ComponentLink2Description: https://datasheet.ciiva.com/2453/pyu-r-int-thick-7-2453380.pdf?src-supplier=Digikey; ComponentLink3URL: https://datasheet.ciiva.com/2453/pyu-r-int-thick-7-2453381.pdf?src-supplier=Digikey; ComponentLink3Description: https://datasheet.ciiva.com/2453/pyu-r-int-thick-7-2453381.pdf?src-supplier=Digikey; ComponentLink4URL: https://datasheet.ciiva.com/2453/pyu-r-int-thick-7-2453379.pdf?src-supplier=Digikey; ComponentLink4Description: https://datasheet.ciiva.com/2453/pyu-r-int-thick-7-2453379.pdf?src-supplier=Digikey; ComponentLink5URL: https://datasheet.ciiva.com/12577/pyu-rc0402-51-rohs-l-6-r-12577269.pdf?src-supplier=Mouser; ComponentLink5Description: https://datasheet.ciiva.com/12577/pyu-rc0402-51-rohs-l-6-r-12577269.pdf?src-supplier=Mouser; ComponentLink6URL: https://datasheet.ciiva.com/7849/1018594-7849833.pdf?src-supplier=Element14; ComponentLink6Description: https://datasheet.ciiva.com/7849/1018594-7849833.pdf?src-supplier=Element14; ComponentLink7URL: https://datasheet.ciiva.com/7849/1018594-7849832.pdf?src-supplier=Element14; ComponentLink7Description: https://datasheet.ciiva.com/7849/1018594-7849832.pdf?src-supplier=Element14; ComponentLink8URL: https://datasheet.ciiva.com/16744/pyu-rc0402-51-rohs-l-6-r-16744492.pdf?src-supplier=Future+Electronics; ComponentLink8Description: https://datasheet.ciiva.com/16744/pyu-rc0402-51-rohs-l-6-r-16744492.pdf?src-supplier=Future+Electronics
R45 = RC0402FR-071KL: RES 1K OHM 1% 1/16W 0402; Manufacturer: Yageo; Resistance: 1kR; Temperature Coefficient: 100ppm/°C; Voltage Rating (DC): 50V; Power Rating: 62.5mW; Max Power Dissipation: 63mW; Item Type: Resistor; Supplier 1: Avnet; Manufacturer Part Number: RC0402FR-071KL; RoHS: Yes; Category: Chip SMD Resistors; Stock 1: 13030000; Pricing 1: 10000=0.00085, 20000=0.00087, 40000=0.00084, 60000=0.00083, 80000=0.00079, 100000=0.00078, 1000000=0.00076 (USD); Case/Package: 0402; Number of Pins: 2; Case Code (Imperial): 0402; Case Code (Metric): 1005; Size Code: 0402; Min Operating Temperature: -55°C; Max Operating Temperature: 155°C; Resistor Type: Thick Film; Tolerance: 1%; Packaging: Tape and Reel; Voltage Rating: 50V; Termination: SMD/SMT; Features: Moisture Resistant; Series: RC; Number of Terminations: 2; Resistance Tolerance: 1%; Construction: Rectangular; Technology: THICK FILM; Length: 1mm; Width: 0.5mm; Height: 0.32mm; Depth: 0.5mm; Reach SVHC Compliant: Yes; Lead Free: Lead Free; RoHS Compliant: Yes; Military Standard: Not; ComponentLink1URL: https://datasheet.ciiva.com/11819/0900766b80c66297-11819477.pdf?src-supplier=RSComponents; ComponentLink1Description: https://datasheet.ciiva.com/11819/0900766b80c66297-11819477.pdf?src-supplier=RSComponents; ComponentLink2URL: https://datasheet.ciiva.com/7983/1018594-7983502.pdf?src-supplier=Element14; ComponentLink2Description: https://datasheet.ciiva.com/7983/1018594-7983502.pdf?src-supplier=Element14; ComponentLink3URL: https://datasheet.ciiva.com/22747/1018594-22747513.pdf?src-supplier=Element14; ComponentLink3Description: https://datasheet.ciiva.com/22747/1018594-22747513.pdf?src-supplier=Element14; ComponentLink4URL: https://datasheet.ciiva.com/12666/pyu-rc0402-51-rohs-l-6-r-12666741.pdf?src-supplier=Mouser; ComponentLink4Description: https://datasheet.ciiva.com/12666/pyu-rc0402-51-rohs-l-6-r-12666741.pdf?src-supplier=Mouser; ComponentLink5URL: https://datasheet.ciiva.com/7849/1018594-7849869.pdf?src-supplier=Element14; ComponentLink5Description: https://datasheet.ciiva.com/7849/1018594-7849869.pdf?src-supplier=Element14; ComponentLink6URL: https://datasheet.ciiva.com/7849/1018594-7849871.pdf?src-supplier=Element14; ComponentLink6Description: https://datasheet.ciiva.com/7849/1018594-7849871.pdf?src-supplier=Element14; ComponentLink7URL: https://datasheet.ciiva.com/17063/pyu-rc0402-51-rohs-l-6-r-17063193.pdf?src-supplier=Future+Electronics; ComponentLink7Description: https://datasheet.ciiva.com/17063/pyu-rc0402-51-rohs-l-6-r-17063193.pdf?src-supplier=Future+Electronics; Supplier Part Number 1: RC0402FR-071KL; LCSC Part Number: C106235
R46-R49 R52 R53 R55-R57 = RT0402BRD0710KL: RES SMD 10K OHM 0.1% 1/16W 0402; Manufacturer: Yageo; Item Type: Resistor; Supplier: Future Electronics; Supplier Part Number: 1236728; Manufacturer Part Number: RT0402BRD0710KL; RoHS: Yes; Category: Chip SMD Resistors; Stock: 490000; Pricing: 10000=0.0218, 20000=0.0213, 30000=0.021, 50000=0.0206, 100000=0.0199 (USD); ComponentLink1URL: https://datasheet.ciiva.com/12836/pyu-rt-1-to-0-05-rohs-l-4-12836454.pdf?src-supplier=Mouser; ComponentLink1Description: https://datasheet.ciiva.com/12836/pyu-rt-1-to-0-05-rohs-l-4-12836454.pdf?src-supplier=Mouser; LCSC Part Number: C190095
R50 R51 = RCS04020000Z0ED: RES SMD 0 OHM JUMPER 1/5W 0402; Manufacturer: Vishay Dale; Resistance: 0mR; Max Power Dissipation: 200mW; Item Type: Resistor; Supplier 1: Digi-Key; Manufacturer Part Number: RCS04020000Z0ED; Stock 1: 35470; Pricing 1: 1=0.1, 10=0.083, 25=0.0576, 50=0.0448, 100=0.032, 250=0.02496, 500=0.01984, 1000=0.01408, 5000=0.01088 (USD); Case/Package: 0402; Case Code (Metric): 1005; Case Code (Imperial): 0402; Min Operating Temperature: -55°C; Max Operating Temperature: 155°C; Packaging: Tape and Reel; Resistor Type: Thick Film; Number of Terminations: 2; Features: Automotive AEC-Q200; Length: 0.039inch; Width: 0.02inch; Height: 0.016inch; RoHS Compliant: Yes; ComponentLink1URL: http://www.farnell.com/datasheets/2618474.pdf?src-supplier=Farnell; ComponentLink1Description: http://www.farnell.com/datasheets/2618474.pdf?src-supplier=Farnell; ComponentLink2URL: http://www.farnell.com/datasheets/2618474.pdf?src-supplier=Element14; ComponentLink2Description: http://www.farnell.com/datasheets/2618474.pdf?src-supplier=Element14; ComponentLink3URL: http://www.vishay.com/docs/20065/rcse3.pdf?src-supplier=Digi-Key; ComponentLink3Description: http://www.vishay.com/docs/20065/rcse3.pdf?src-supplier=Digi-Key; ComponentLink4URL: http://www.farnell.com/datasheets/2618474.pdf?src-supplier=Newark; ComponentLink4Description: http://www.farnell.com/datasheets/2618474.pdf?src-supplier=Newark; Supplier Part Number 1: 541-2877-1-ND; LCSC Part Number: C844673
R54 = RC0402JR-07200KL: Res Thick Film 0402 200K Ohm 5% 1/16W; Manufacturer: Yageo; Resistance: 200kR; Temperature Coefficient: 100ppm/°C; Power Rating: 62.5mW; Voltage Rating: 50V; Max Power Dissipation: 63mW; Supplier 1: Digi-Key; Manufacturer Part Number: RC0402JR-07200KL; RoHS: Yes; Category: Chip SMD Resistors; Stock 1: 182081; Pricing 1: 1=0.10000, 10=0.01300, 100=0.00540, 1000=0.00244, 2500=0.00212, 5000=0.00175 (USD); Case/Package: 0402; Contact Plating: Tin,Matte; Case Code (Metric): 1005; Case Code (Imperial): 0402; Weight: 2.3E-05oz; Size Code: 0402; Min Operating Temperature: -55°C; Max Operating Temperature: 155°C; Tolerance: 5%; Resistor Type: Thick Film; Package Quantity: 1; Packaging: Tape and Reel; Number of Terminations: 2; Termination: SMD/SMT; Voltage Rating (DC): 50V; Features: Moisture Resistant; Series: RC; Construction: Rectangular; Resistance Tolerance: 5%; Length: 1mm; Width: 0.02inch; Height: 0.016inch; Depth: 0.5mm; Radiation Hardening: No; REACH SVHC: No SVHC; Military Standard: Not; Lead Free: Lead Free; RoHS Compliant: Yes; ComponentLink1URL: https://datasheet.ciiva.com/2452/pyu-r-int-thick-7-2452740.pdf?src-supplier=Digi-Key; ComponentLink1Description: https://datasheet.ciiva.com/2452/pyu-r-int-thick-7-2452740.pdf?src-supplier=Digi-Key; ComponentLink2URL: https://datasheet.ciiva.com/2452/pyu-r-int-thick-7-2452741.pdf?src-supplier=Digi-Key; ComponentLink2Description: https://datasheet.ciiva.com/2452/pyu-r-int-thick-7-2452741.pdf?src-supplier=Digi-Key; ComponentLink3URL: https://datasheet.ciiva.com/8886/pyu-rc0402-51-rohs-l-6-8886901.pdf?src-supplier=Avnet; ComponentLink3Description: https://datasheet.ciiva.com/8886/pyu-rc0402-51-rohs-l-6-8886901.pdf?src-supplier=Avnet; ComponentLink4URL: https://datasheet.ciiva.com/28393/pyu-rc0402-51-rohs-l-6-28393445.pdf?src-supplier=Avnet+Europe; ComponentLink4Description: https://datasheet.ciiva.com/28393/pyu-rc0402-51-rohs-l-6-28393445.pdf?src-supplier=Avnet+Europe; ComponentLink5URL: https://datasheet.ciiva.com/2452/pyu-r-int-thick-7-2452742.pdf?src-supplier=Digi-Key; ComponentLink5Description: https://datasheet.ciiva.com/2452/pyu-r-int-thick-7-2452742.pdf?src-supplier=Digi-Key; ComponentLink6URL: https://datasheet.ciiva.com/12577/pyu-rc0402-51-rohs-l-6-r-12577561.pdf?src-supplier=Mouser; ComponentLink6Description: https://datasheet.ciiva.com/12577/pyu-rc0402-51-rohs-l-6-r-12577561.pdf?src-supplier=Mouser; ComponentLink7URL: https://datasheet.ciiva.com/7983/1018594-7983562.pdf?src-supplier=Element14; ComponentLink7Description: https://datasheet.ciiva.com/7983/1018594-7983562.pdf?src-supplier=Element14; ComponentLink8URL: https://datasheet.ciiva.com/17485/pyu-rc0402-51-rohs-l-6-r-17485631.pdf?src-supplier=Future+Electronics; ComponentLink8Description: https://datasheet.ciiva.com/17485/pyu-rc0402-51-rohs-l-6-r-17485631.pdf?src-supplier=Future+Electronics; Supplier Part Number 1: 311-200KJRCT-ND; LCSC Part Number: C137903
U9 = MIC803-29D4VM3-TR: IC SUPERVISOR 1 CHANNEL SOT23-3; Manufacturer: Microchip; Min Supply Voltage: 1V; Max Supply Voltage: 5.5V; Number of Voltages Monitored: 1; Reset: Active Low; Reset Timeout: 1.12s; Threshold Voltage: 2.93V; Operating Supply Current: 4.5uA; Watchdog Timer: No; Max Reset Threshold Voltage: 3.05V; Supply Current: 18uA; Supplier: Digikey; LCSC Part Number: C626154; Manufacturer Part Number: MIC803-29D4VM3-TR; RoHS: Yes; Item Type: IC; Stock: 5352; Pricing: 1=0.43, 25=0.35, 100=0.33 (USD); Mounting Technology: Surface Mount; Case/Package: SOT-23-3; Pins: 3; Min Operating Temperature: -40°C; Max Operating Temperature: 125°C; Type: Simple Reset/Power-On Reset; Packaging: Tape and Reel; Number of Elements: 1; Series: -; Reach SVHC Compliant: No; RoHS Compliant: Yes; ComponentLink1URL: https://datasheet.ciiva.com/5838/1441861-5838549.pdf?src-supplier=Farnell; ComponentLink1Description: https://datasheet.ciiva.com/5838/1441861-5838549.pdf?src-supplier=Farnell; ComponentLink2URL: https://datasheet.ciiva.com/12957/mic803-12957068.pdf?src-supplier=Mouser; ComponentLink2Description: https://datasheet.ciiva.com/12957/mic803-12957068.pdf?src-supplier=Mouser; ComponentLink3URL: https://datasheet.ciiva.com/16462/mic803-16462056.pdf?src-supplier=Future+Electronics; ComponentLink3Description: https://datasheet.ciiva.com/16462/mic803-16462056.pdf?src-supplier=Future+Electronics
U10 = USB7002-I/KDX: IC USB HUB CNTRLR 100VQFN; Manufacturer: Microchip; Supplier: Digikey; Supplier Part Number: USB7002-I/KDX-ND; Manufacturer Part Number: USB7002-I/KDX; RoHS: Yes; Item Type: IC; Stock: 148; Pricing: 1=10.9, 25=9.09, 100=8.775 (USD); Case/Package: VQFN; Interface: USB; Packaging: Tray; Series: Automotive, AEC-Q100; RoHS Compliant: Yes; ComponentLink1URL: http://ww1.microchip.com/downloads/en/devicedoc/00002445a.pdf?src-supplier=Digikey; ComponentLink1Description: http://ww1.microchip.com/downloads/en/devicedoc/00002445a.pdf?src-supplier=Digikey
U11 = PIC18F6627T-E/PT: IC MCU 8BIT 96KB FLASH 64TQFP; Manufacturer: Microchip; Item Type: Microcontrollers; Interface: I2C,SPI,UART,USART; Number of Timers/Counters: 5; Max Supply Voltage: 5.5V; Min Supply Voltage: 4.2V; Frequency: 40MHz; RAM Size: 3936B; Operating Supply Voltage: 5V; Max Power Dissipation: 1W; Data Bus Width: 8b; Number of Programmable I/O: 54; Watchdog Timer: Yes; Access Time: 40us; Core Architecture: PIC; Peripherals: Brown-out Detect/Reset,POR,PWM,WDT,HLVD; Oscillator Type: Internal; Supplier: Digikey; Supplier Part Number: PIC18F6627T-E/PT-ND; Manufacturer Part Number: PIC18F6627T-E/PT; RoHS: Yes; Pricing: 1200=9.8625 (USD); Mounting Technology: Surface Mount; Case/Package: TQFP; Pins: 64; Min Operating Temperature: -40°C; Max Operating Temperature: 125°C; Package Quantity: 1200; Packaging: Tape and Reel; Clock Frequency: 40MHz; Memory Format: FLASH; Memory Size: 96KB; Series: PIC® 18F; Radiation Hardening: No; Lead Free: Lead Free; RoHS Compliant: Yes; ComponentLink1URL: https://datasheet.ciiva.com/1496/39646c-1496640.pdf?src-supplier=Avnet; ComponentLink1Description: https://datasheet.ciiva.com/1496/39646c-1496640.pdf?src-supplier=Avnet; ComponentLink2URL: https://datasheet.ciiva.com/6650/39646c-6650215.pdf?src-supplier=Digikey; ComponentLink2Description: https://datasheet.ciiva.com/6650/39646c-6650215.pdf?src-supplier=Digikey
X1 = ECS-2033-250-BN: XTAL OSC XO 25.0000MHZ CMOS SMD; Manufacturer: ECS International; Item Type: Oscillators; Supplier: Digikey; LCSC Part Number: C2441279; Manufacturer Part Number: ECS-2033-250-BN; RoHS: Yes; Stock: 33494; Pricing: 1=2.82, 10=2.757, 50=2.626, 100=2.2978, 500=2.2321 (USD); ComponentLink1URL: https://datasheet.ciiva.com/865/ecs-2025-2033-865424.pdf?src-supplier=Digikey; ComponentLink1Description: https://datasheet.ciiva.com/865/ecs-2025-2033-865424.pdf?src-supplier=Digikey; ComponentLink2URL: https://datasheet.ciiva.com/865/ecs-2025-2033-865425.pdf?src-supplier=Digikey; ComponentLink2Description: https://datasheet.ciiva.com/865/ecs-2025-2033-865425.pdf?src-supplier=Digikey; ComponentLink3URL: https://datasheet.ciiva.com/865/ecs-2025-2033-865426.pdf?src-supplier=Digikey; ComponentLink3Description: https://datasheet.ciiva.com/865/ecs-2025-2033-865426.pdf?src-supplier=Digikey

## Sheet Power_Section.SchDoc
size 420 x 297 mm; SheetNumber: 2; SheetTotal: 3
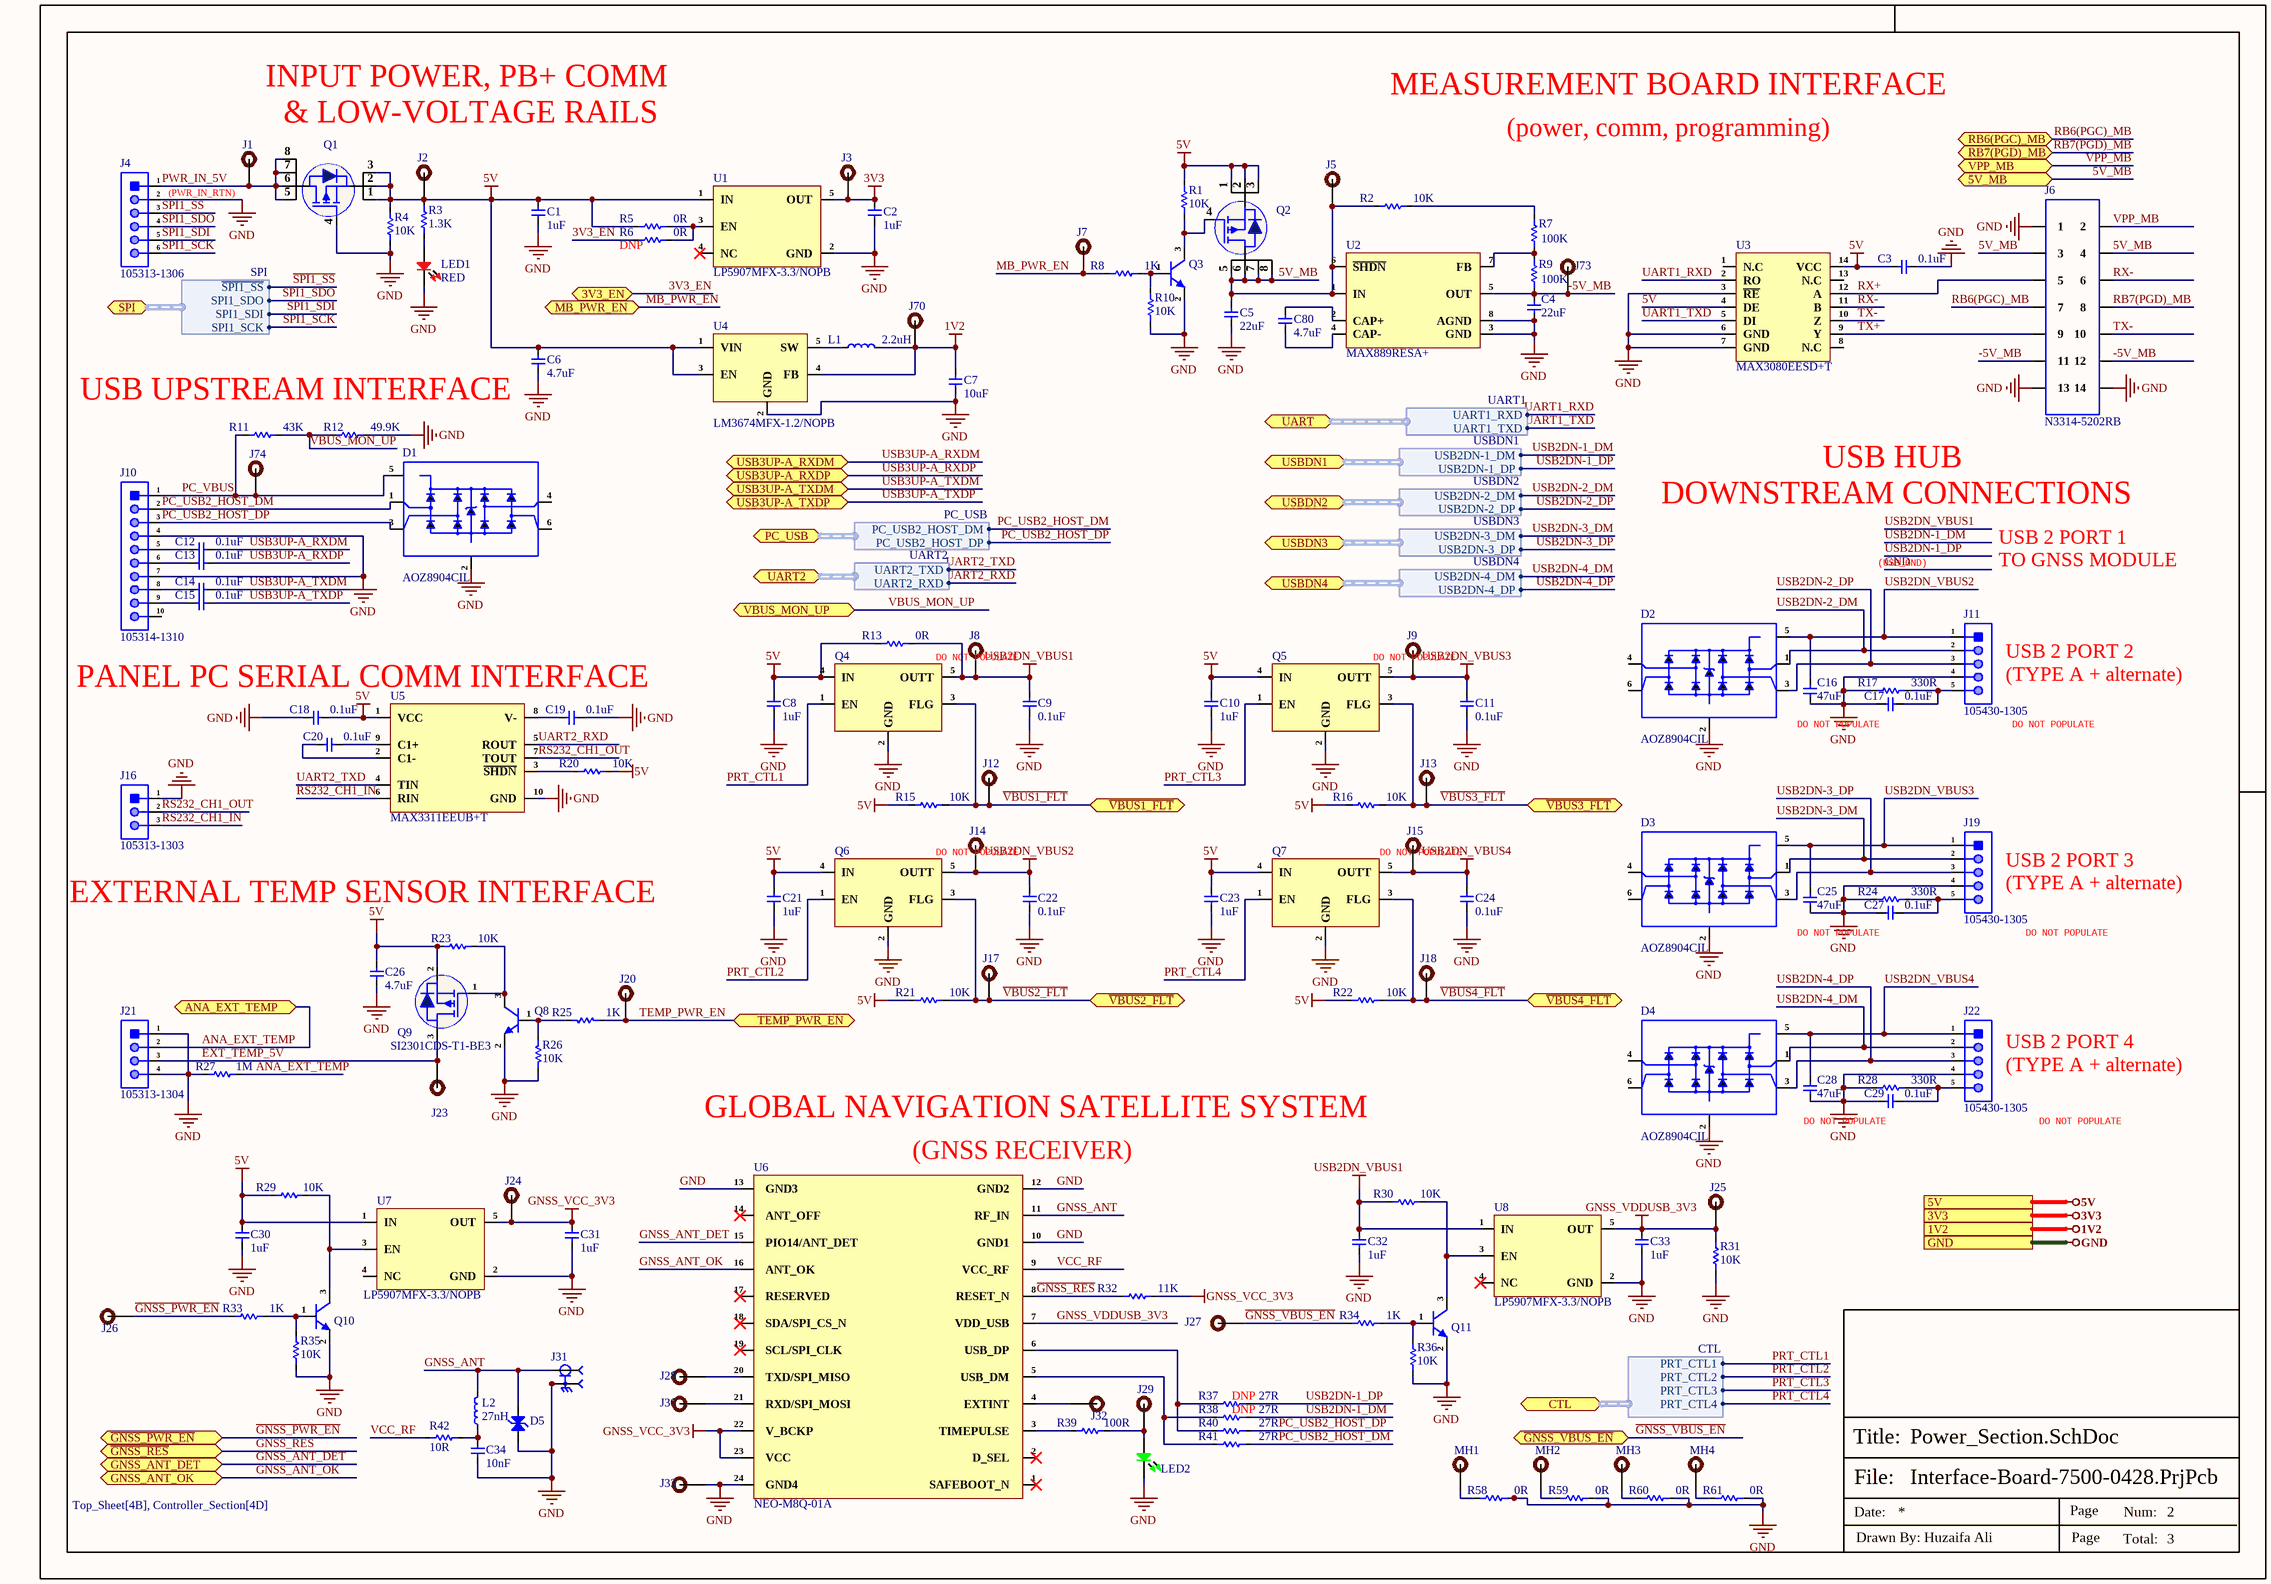
[diagram p2: Power_Section.SchDoc]